# Altium schematic sheet Sheet4_Carregador_Bateria.SchDoc
size A4; SheetNumber: 4; SheetTotal: 6
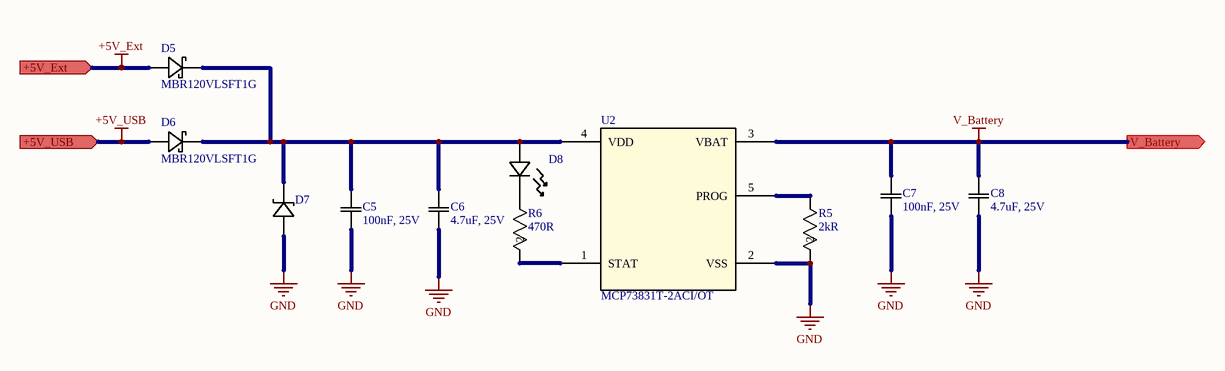
[diagram p0: Sheet4_Carregador_Bateria.SchDoc]

## Parts
?  (no value)  (graphical)
C5  100nF, 25V  [CAP_CL21_SAM]
C6  4.7uF, 25V  [CAP_2012_TDK]
C7  100nF, 25V  [CAP_CL21_SAM]
C8  4.7uF, 25V  [CAP_2012_TDK]
D5  MBR120VLSFT1G  [SDO_SOD-123FL_ONS]
D6  MBR120VLSFT1G  [SDO_SOD-123FL_ONS]
D7  MMSZ5246B-TP  [ZDO_SOD123_MCC]  (value not drawn)
D8  VAOL-S8SB4  [LED_VCCLITE_0805_VCC]  (value not drawn)
R5  2kR  [RC0805N_PAN]
R6  470R  [RC0805N_VIS]
U2  MCP73831T-2ACI/OT  [SOT-23-5_MC_MCH]

## Ports
+5V_Ext (in, see Sheet2_Hierarquia[2B], Sheet3_Buck[4B], Sheet6_Power_Path[2A]), +5V_USB (in, see Sheet2_Hierarquia[2B], Sheet6_Power_Path[2B]), V_Battery (out, see Sheet2_Hierarquia[2B], Sheet5_Proteção_Bateria[1A])

## Nets
+5V_Ext: D5.2 ; port +5V_Ext
+5V_USB: D6.2 ; port +5V_USB
GND: C5.1 C6.1 C7.1 C8.1 D7.2 R5.2 U2.2(VSS)
V_Battery: C7.2 C8.2 U2.3(VBAT) ; port V_Battery
NetC5_2: C5.2 C6.2 D5.1 D6.1 D7.1 D8.2 U2.4(VDD)
NetD8_1: D8.1 R6.1
NetR5_1: R5.1 U2.5(PROG)
NetR6_2: R6.2 U2.1(STAT)

## Notes on the sheet
- Título:
- Endereço:
- Rua Aprígio Veloso, 1500 - Bodocongó
  CEP:58.429-140
  Campina Grande, Paraíba
  Brasil
- Projeto:
- Conta:
- Projetista:
- Arquivo:
- Data:
- Revisor:
- Pág.:
- Rev.:
- de

## Library data of the parts
? = Title Block
C5 C7 = CL21B104KACNNNC: Description; Manufacturer_Name: Samsung; Copyright: Copyright (C) 2025 Ultra Librarian. All rights reserved.; Manufacturer_Part_Number: CL21B104KACNNNC
C6 C8 = C2012X5R1E475K125AB: CAP CER 4.7UF 25V X5R 0805; Manufacturer_Name: TDK; Copyright: Copyright (C) 2026 Ultra Librarian. All rights reserved.; Manufacturer_Part_Number: C2012X5R1E475K125AB
D5 D6 = MBR120VLSFT1G: No Description Available; Manufacturer_Name: onsemi; Copyright: Copyright (C) 2026 Ultra Librarian. All rights reserved.; Manufacturer_Part_Number: MBR120VLSFT1G
D7 = MMSZ5246B-TP: DIODE ZENER 16V 500MW SOD123; Manufacturer_Name: MCC; Copyright: Copyright (C) 2026 Ultra Librarian. All rights reserved.; Manufacturer_Part_Number: MMSZ5246B-TP
D8 = VAOL-S8SB4: No Description Available; Manufacturer_Name: VCC; Copyright: Copyright (C) 2026 Ultra Librarian. All rights reserved.; Manufacturer_Part_Number: VAOL-S8SB4
R5 = ERJ-6ENF2001V: Description; Manufacturer_Name: Panasonic; Copyright: Copyright (C) 2025 Ultra Librarian. All rights reserved.; Manufacturer_Part_Number: ERJ-6ENF2001V
R6 = CRCW0805470RJNEA: No Description Available; Manufacturer_Name: Vishay; Copyright: Copyright (C) 2026 Ultra Librarian. All rights reserved.; Manufacturer_Part_Number: CRCW0805470RJNEA; Datasheet: https://www.vishay.com/doc?20035
U2 = MCP73831T-2ACIOT: Description; Manufacturer_Name: Microchip; Copyright: Copyright (C) 2026 Ultra Librarian. All rights reserved.; Manufacturer_Part_Number: MCP73831T-2ACI/OT; RefDes: RefDes; Type: Type